# Altium schematic sheet AM_PM_Indicator.SchDoc
size A3; SheetNumber: 7; SheetTotal: 16
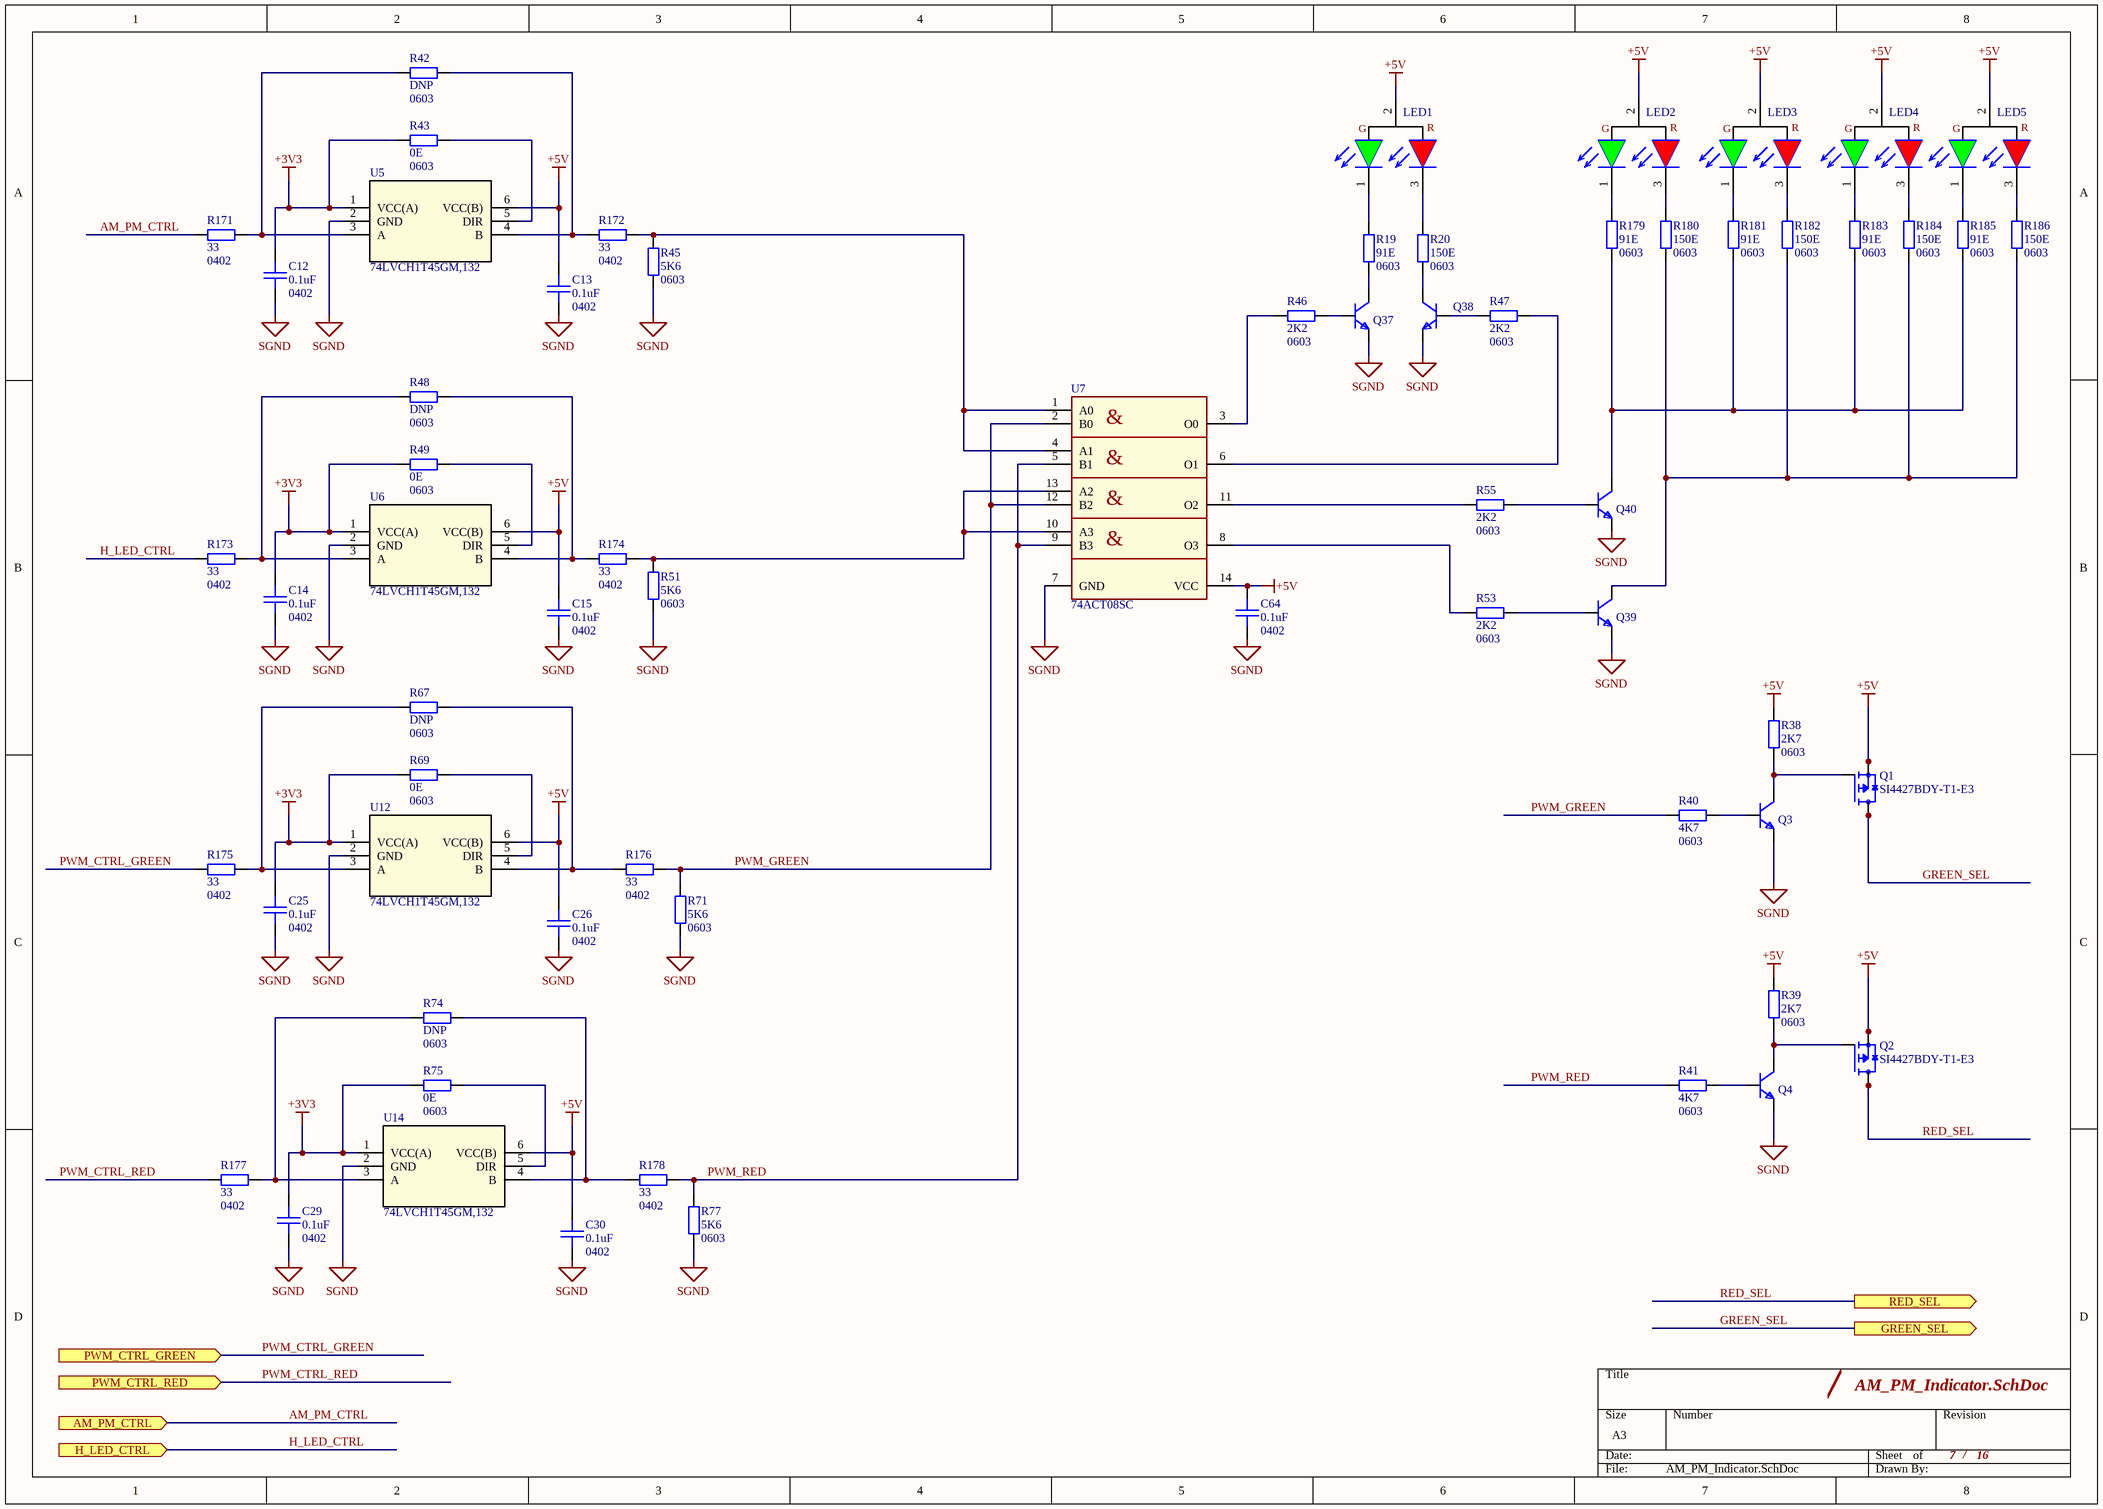
[diagram p0: AM_PM_Indicator.SchDoc]

## Parts
C12  Capacitance: 0.1uF  Package1: 0402  [CAPC100x50x50L25]  (hidden comment: 04023C104KAT2A)
C13  Capacitance: 0.1uF  Package1: 0402  [CAPC100x50x50L25]  (hidden comment: 04023C104KAT2A)
C14  Capacitance: 0.1uF  Package1: 0402  [CAPC100x50x50L25]  (hidden comment: 04023C104KAT2A)
C15  Capacitance: 0.1uF  Package1: 0402  [CAPC100x50x50L25]  (hidden comment: 04023C104KAT2A)
C25  Capacitance: 0.1uF  Package1: 0402  [CAPC100x50x50L25]  (hidden comment: 04023C104KAT2A)
C26  Capacitance: 0.1uF  Package1: 0402  [CAPC100x50x50L25]  (hidden comment: 04023C104KAT2A)
C29  Capacitance: 0.1uF  Package1: 0402  [CAPC100x50x50L25]  (hidden comment: 04023C104KAT2A)
C30  Capacitance: 0.1uF  Package1: 0402  [CAPC100x50x50L25]  (hidden comment: 04023C104KAT2A)
C64  Capacitance: 0.1uF  Package1: 0402  [CAPC100x50x50L25]  (hidden comment: 04023C104KAT2A)
LED1  484759  [LED_3mm_bicolor]  (value not drawn)
LED2  484759  [LED_3mm_bicolor]  (value not drawn)
LED3  484759  [LED_3mm_bicolor]  (value not drawn)
LED4  484759  [LED_3mm_bicolor]  (value not drawn)
LED5  484759  [LED_3mm_bicolor]  (value not drawn)
Q1  SI4427BDY-T1-E3  [SOIC8_127P600X175-8N]
Q2  SI4427BDY-T1-E3  [SOIC8_127P600X175-8N]
Q3  MMBT3904-TP  [SOT-23_MCC]  (value not drawn)
Q4  MMBT3904-TP  [SOT-23_MCC]  (value not drawn)
Q37  MMBT3904-TP  [SOT-23_MCC]  (value not drawn)
Q38  MMBT3904-TP  [SOT-23_MCC]  (value not drawn)
Q39  MMBT3904-TP  [SOT-23_MCC]  (value not drawn)
Q40  MMBT3904-TP  [SOT-23_MCC]  (value not drawn)
R19  Resistance: 91E  Size2: 0603  [RESC160X80X55L30]  (hidden comment: RC0603JR-0791RL)
R20  Resistance: 150E  Size2: 0603  [RESC160X80X55L30]  (hidden comment: RC0603JR-07150RL)
R38  Resistance: 2K7  Size2: 0603  [RESC160X80X55L30]  (hidden comment: RC0603FR-072K7L)
R39  Resistance: 2K7  Size2: 0603  [RESC160X80X55L30]  (hidden comment: RC0603FR-072K7L)
R40  Resistance: 4K7  Size2: 0603  [RESC160X80X55L30]  (hidden comment: RC0603FR-074K7L)
R41  Resistance: 4K7  Size2: 0603  [RESC160X80X55L30]  (hidden comment: RC0603FR-074K7L)
R42  Size2: 0603  [RESC160X80X55L30]  (hidden comment: DNP)
R43  Resistance: 0E  Size2: 0603  [RESC160X80X55L30]  (hidden comment: RC0603JR-070RL)
R45  Resistance: 5K6  Size2: 0603  [RESC160X80X55L30]  (hidden comment: CRCW06035K60JNEA)
R46  Resistance: 2K2  Size2: 0603  [RESC160X80X55L30]  (hidden comment: RC0603FR-072K2L)
R47  Resistance: 2K2  Size2: 0603  [RESC160X80X55L30]  (hidden comment: RC0603FR-072K2L)
R48  Size2: 0603  [RESC160X80X55L30]  (hidden comment: DNP)
R49  Resistance: 0E  Size2: 0603  [RESC160X80X55L30]  (hidden comment: RC0603JR-070RL)
R51  Resistance: 5K6  Size2: 0603  [RESC160X80X55L30]  (hidden comment: CRCW06035K60JNEA)
R53  Resistance: 2K2  Size2: 0603  [RESC160X80X55L30]  (hidden comment: RC0603FR-072K2L)
R55  Resistance: 2K2  Size2: 0603  [RESC160X80X55L30]  (hidden comment: RC0603FR-072K2L)
R67  Resistance: DNP  Size2: 0603  [RESC160X80X55L30]  (hidden comment: RC0603JR-070RL)
R69  Resistance: 0E  Size2: 0603  [RESC160X80X55L30]  (hidden comment: RC0603JR-070RL)
R71  Resistance: 5K6  Size2: 0603  [RESC160X80X55L30]  (hidden comment: CRCW06035K60JNEA)
R74  Size2: 0603  [RESC160X80X55L30]  (hidden comment: DNP)
R75  Resistance: 0E  Size2: 0603  [RESC160X80X55L30]  (hidden comment: RC0603JR-070RL)
R77  Resistance: 5K6  Size2: 0603  [RESC160X80X55L30]  (hidden comment: CRCW06035K60JNEA)
R171  Resistance: 33  Package2: 0402  [RESC100X50X40L25]  (hidden comment: RC0402FR-0733RL)
R172  Resistance: 33  Package2: 0402  [RESC100X50X40L25]  (hidden comment: RC0402FR-0733RL)
R173  Resistance: 33  Package2: 0402  [RESC100X50X40L25]  (hidden comment: RC0402FR-0733RL)
R174  Resistance: 33  Package2: 0402  [RESC100X50X40L25]  (hidden comment: RC0402FR-0733RL)
R175  Resistance: 33  Package2: 0402  [RESC100X50X40L25]  (hidden comment: RC0402FR-0733RL)
R176  Resistance: 33  Package2: 0402  [RESC100X50X40L25]  (hidden comment: RC0402FR-0733RL)
R177  Resistance: 33  Package2: 0402  [RESC100X50X40L25]  (hidden comment: RC0402FR-0733RL)
R178  Resistance: 33  Package2: 0402  [RESC100X50X40L25]  (hidden comment: RC0402FR-0733RL)
R179  Resistance: 91E  Size2: 0603  [RESC160X80X55L30]  (hidden comment: RC0603JR-0791RL)
R180  Resistance: 150E  Size2: 0603  [RESC160X80X55L30]  (hidden comment: RC0603JR-07150RL)
R181  Resistance: 91E  Size2: 0603  [RESC160X80X55L30]  (hidden comment: RC0603JR-0791RL)
R182  Resistance: 150E  Size2: 0603  [RESC160X80X55L30]  (hidden comment: RC0603JR-07150RL)
R183  Resistance: 91E  Size2: 0603  [RESC160X80X55L30]  (hidden comment: RC0603JR-0791RL)
R184  Resistance: 150E  Size2: 0603  [RESC160X80X55L30]  (hidden comment: RC0603JR-07150RL)
R185  Resistance: 91E  Size2: 0603  [RESC160X80X55L30]  (hidden comment: RC0603JR-0791RL)
R186  Resistance: 150E  Size2: 0603  [RESC160X80X55L30]  (hidden comment: RC0603JR-07150RL)
U5  74LVCH1T45GM,132  [74LVCH1T45_XSON6_NEX]
U6  74LVCH1T45GM,132  [74LVCH1T45_XSON6_NEX]
U7  74ACT08SC  [SOIC14P127_865X600X175L83X41]
U12  74LVCH1T45GM,132  [74LVCH1T45_XSON6_NEX]
U14  74LVCH1T45GM,132  [74LVCH1T45_XSON6_NEX]

## Ports
AM_PM_CTRL (in), GREEN_SEL (out), H_LED_CTRL (in), PWM_CTRL_GREEN (in), PWM_CTRL_RED (in), RED_SEL (out)

## Nets
+3V3: C12.2 C14.2 C25.2 C29.2 R43.2 R49.2 R69.2 R75.2 U5.1(VCC(A)) U6.1(VCC(A)) U12.1(VCC(A)) U14.1(VCC(A))
+5V: C13.2 C15.2 C26.2 C30.2 C64.2 LED1.2(A) LED2.2(A) LED3.2(A) LED4.2(A) LED5.2(A) Q1.1(S) Q1.2(S) Q1.3(S) Q2.1(S) Q2.2(S) Q2.3(S) R38.2 R39.2 U5.6(VCC(B)) U6.6(VCC(B)) U7.14(VCC) U12.6(VCC(B)) U14.6(VCC(B))
SGND: C12.1 C13.1 C14.1 C15.1 C25.1 C26.1 C29.1 C30.1 C64.1 Q3.2(E) Q4.2(E) Q37.2(E) Q38.2(E) Q39.2(E) Q40.2(E) R45.1 R51.1 R71.1 R77.1 U5.2(GND) U6.2(GND) U7.7(GND) U12.2(GND) U14.2(GND)
AM_PM_CTRL: R171.2 ; port AM_PM_CTRL
GREEN_SEL: Q1.5(D) Q1.6(D) Q1.7(D) Q1.8(D) ; port GREEN_SEL
H_LED_CTRL: R173.2 ; port H_LED_CTRL
PWM_CTRL_GREEN: R175.2 ; port PWM_CTRL_GREEN
PWM_CTRL_RED: R177.2 ; port PWM_CTRL_RED
PWM_GREEN: R40.2 R71.2 R176.1 U7.2(B0) U7.12(B2)
PWM_RED: R41.2 R77.2 R178.1 U7.5(B1) U7.9(B3)
RED_SEL: Q2.5(D) Q2.6(D) Q2.7(D) Q2.8(D) ; port RED_SEL
NetLED1_1: LED1.1(CG) R19.1
NetLED1_3: LED1.3(CR) R20.1
NetLED2_1: LED2.1(CG) R179.1
NetLED2_3: LED2.3(CR) R180.1
NetLED3_1: LED3.1(CG) R181.1
NetLED3_3: LED3.3(CR) R182.1
NetLED4_1: LED4.1(CG) R183.1
NetLED4_3: LED4.3(CR) R184.1
NetLED5_1: LED5.1(CG) R185.1
NetLED5_3: LED5.3(CR) R186.1
NetQ1_4: Q1.4(G) Q3.3(C) R38.1
NetQ2_4: Q2.4(G) Q4.3(C) R39.1
NetQ3_1: Q3.1(B) R40.1
NetQ4_1: Q4.1(B) R41.1
NetQ37_1: Q37.1(B) R46.2
NetQ37_3: Q37.3(C) R19.2
NetQ38_1: Q38.1(B) R47.1
NetQ38_3: Q38.3(C) R20.2
NetQ39_1: Q39.1(B) R53.2
NetQ39_3: Q39.3(C) R180.2 R182.2 R184.2 R186.2
NetQ40_1: Q40.1(B) R55.2
NetQ40_3: Q40.3(C) R179.2 R181.2 R183.2 R185.2
NetR42_1: R42.1 R172.2 U5.4(B)
NetR42_2: R42.2 R171.1 U5.3(A)
NetR43_1: R43.1 U5.5(DIR)
NetR45_2: R45.2 R172.1 U7.1(A0) U7.4(A1)
NetR46_1: R46.1 U7.3(O0)
NetR47_2: R47.2 U7.6(O1)
NetR48_1: R48.1 R174.2 U6.4(B)
NetR48_2: R48.2 R173.1 U6.3(A)
NetR49_1: R49.1 U6.5(DIR)
NetR51_2: R51.2 R174.1 U7.10(A3) U7.13(A2)
NetR53_1: R53.1 U7.8(O3)
NetR55_1: R55.1 U7.11(O2)
NetR67_1: R67.1 R176.2 U12.4(B)
NetR67_2: R67.2 R175.1 U12.3(A)
NetR69_1: R69.1 U12.5(DIR)
NetR74_1: R74.1 R178.2 U14.4(B)
NetR74_2: R74.2 R177.1 U14.3(A)
NetR75_1: R75.1 U14.5(DIR)

## Notes on the sheet
- /
- (in symbol 74ACT08SC) &
- (in symbol LED_484759_bicolor) G; R

## Library data of the parts
C12-C15 C25 C26 C29 C30 C64 = CMP-001-0374-4: 0402 25V X7R 100 NF 10%; Manufacturer: KYOCERA AVX; Op Temp max: 85°C; Op Temp min: -55°C; ComponentLink3URL: https://www.digikey.com/en/products/detail/yageo/CC0402MRX5R5BB106/5195138; MPN: 04023C104KAT2A; ComponentLink1URL: https://www.yageo.com/upload/media/product/productsearch/datasheet/mlcc/UPY-GPHC_X5R_4V-to-50V_26.pdf; Package: 0402 (1005 Metric); Size: 1.00mm x 0.50mm; Height max: 700µm; Mounting Type: SM; Tolerance: 10%; ComponentLink1Description: Datasheet; ComponentLink3Description: Digikey; Ratings: -; Dielectric: X7R; ComponentLink2Description: Mouser; ComponentLink2URL: https://eu.mouser.com/ProductDetail/YAGEO/CC0402MRX5R5BB106?qs=zEY9bCHj09eCmUJdZuS5Lg%3D%3D; Lead Spacing: 0mm; Component Type: Ceramic Capacitor; Voltage Rating: 25V
LED1-LED5 = LED_484759_bicolor: Parameter 1: https://cdn.shopify.com/s/files/1/0695/1347/8453/files/484759.pdf; ComponentLink1Description: Datasheet; ComponentLink1URL: https://cdn.shopify.com/s/files/1/0695/1347/8453/files/484759.pdf
Q1 Q2 = SI4427BDY-T1-E3: MOSFET P-CH 30V 9.7A 8SO; MF: Vishay Siliconix; Drive Voltage (Max Rds On, Min Rds On): 2.5V, 10V; FET Type: P-Channel; Current - Continuous Drain (Id) @ 25°C: 9.7A (Ta); Vgs(th) (Max) @ Id: 1.4V @ 250µA; Gate Charge (Qg) (Max) @ Vgs: 70 nC @ 4.5 V; DigiKey: https://www.digikey.bg/en/products/detail/vishay-siliconix/SI4427BDY-T1-E3/1656428; MPN: SI4427BDY-T1-E3; Package: SOIC-8 Vishay Siliconix; Drain to Source Voltage (Vdss): 30V; ComponentLink1Description: Datasheet; ComponentLink1URL: https://www.vishay.com/docs/72295/si4427bd.pdf
Q3 Q4 Q37-Q40 = MMBT3904-TP: TRANS NPN 40V 0.2A SOT23; Mfr_Name: MCC; Current - Collector (Ic) (Max): 200 mA; MPN: MMBT3904-TP; Voltage - Collector Emitter Breakdown (Max): 40 V; Transistor Type: NPN
R19 R179 R181 R183 R185 = CMP-001-0628-7: RES 91 OHM 5% 1/10W 0603; Manufacturer: YAGEO; Power: 100mW; Temperature Coefficient: ±100ppm; Tolerance: 1%; Op Temp max: 155°C; Op Temp min: -55°C; PMNT: DNP; Ratings: -; ComponentLink3URL: https://www.digikey.com/en/products/detail/yageo/RC0603FR-0710KL/726880?s=N4IgTCBcDaIEoGEAMA2JBmAYnAtEg7AIxIDSAMiALoC%2BQA; Size: 1.60mm x 0.80mm; ComponentLink1Description: Datasheet; ComponentLink3Description: Digikey; ComponentLink2Description: Mouser; ComponentLink1URL: https://www.yageo.com/upload/media/product/products/datasheet/rchip/PYu-RC_51_RoHS_P_4.pdf; Composition: Thick Film; Package: 0603 (1608 Metric); ComponentLink2URL: https://eu.mouser.com/ProductDetail/YAGEO/RC0603FR-0710KL?qs=grNVn54RoB%252B3GtjbJj3wJQ%3D%3D; Mounting Type: SM; Height max: 550µm; MPN: RC0603JR-0791RL; Component Type: Chip Resistor
R20 R180 R182 R184 R186 = CMP-001-0628-7: RES 150 OHM 5% 1/10W 0603; Manufacturer: YAGEO; Power: 100mW; Temperature Coefficient: ±100ppm; Tolerance: 1%; Op Temp max: 155°C; Op Temp min: -55°C; Ratings: -; ComponentLink3URL: https://www.digikey.com/en/products/detail/yageo/RC0603FR-0710KL/726880?s=N4IgTCBcDaIEoGEAMA2JBmAYnAtEg7AIxIDSAMiALoC%2BQA; Size: 1.60mm x 0.80mm; ComponentLink1Description: Datasheet; ComponentLink3Description: Digikey; ComponentLink2Description: Mouser; ComponentLink1URL: https://www.yageo.com/upload/media/product/products/datasheet/rchip/PYu-RC_51_RoHS_P_4.pdf; Composition: Thick Film; Package: 0603 (1608 Metric); ComponentLink2URL: https://eu.mouser.com/ProductDetail/YAGEO/RC0603FR-0710KL?qs=grNVn54RoB%252B3GtjbJj3wJQ%3D%3D; Mounting Type: SM; Height max: 550µm; MPN: RC0603JR-07150RL; Component Type: Chip Resistor
R38 R39 = CMP-001-0628-7: RES 2.7K OHM 1% 1/10W 0603; Manufacturer: YAGEO; Power: 100mW; Temperature Coefficient: ±100ppm; Op Temp max: 155°C; Op Temp min: -55°C; Ratings: -; ComponentLink3URL: https://www.digikey.com/en/products/detail/yageo/RC0603FR-0710KL/726880?s=N4IgTCBcDaIEoGEAMA2JBmAYnAtEg7AIxIDSAMiALoC%2BQA; Size: 1.60mm x 0.80mm; ComponentLink1Description: Datasheet; ComponentLink3Description: Digikey; ComponentLink2Description: Mouser; ComponentLink1URL: https://www.yageo.com/upload/media/product/products/datasheet/rchip/PYu-RC_51_RoHS_P_4.pdf; Composition: Thick Film; Package: 0603 (1608 Metric); ComponentLink2URL: https://eu.mouser.com/ProductDetail/YAGEO/RC0603FR-0710KL?qs=grNVn54RoB%252B3GtjbJj3wJQ%3D%3D; Mounting Type: SM; Tolerance: 1%; Height max: 550µm; MPN: RC0603FR-072K7L; Component Type: Chip Resistor
R40 R41 = CMP-001-0628-7: RES 4.7K OHM 1% 1/10W 0603; Manufacturer: YAGEO; Power: 100mW; Temperature Coefficient: ±100ppm; Op Temp max: 155°C; Op Temp min: -55°C; PMNT: DNP; Ratings: -; Size: 1.60mm x 0.80mm; ComponentLink1Description: Datasheet; ComponentLink3Description: Digikey; ComponentLink2Description: Mouser; ComponentLink1URL: https://www.yageo.com/upload/media/product/products/datasheet/rchip/PYu-RC_51_RoHS_P_4.pdf; Composition: Thick Film; Package: 0603 (1608 Metric); ComponentLink2URL: https://eu.mouser.com/ProductDetail/YAGEO/RC0603FR-0710KL?qs=grNVn54RoB%252B3GtjbJj3wJQ%3D%3D; Mounting Type: SM; Tolerance: 1%; Height max: 550µm; MPN: RC0603FR-074K7L; Component Type: Chip Resistor
  R40: ComponentLink3URL: https://www.digikey.pl/en/products/detail/yageo/rc0603fr-074k7l/727212
  R41: ComponentLink3URL: https://www.digikey.com/en/products/detail/yageo/RC0603FR-0710KL/726880?s=N4IgTCBcDaIEoGEAMA2JBmAYnAtEg7AIxIDSAMiALoC%2BQA
R42 R48 R67 R74 = CMP-001-0628-7: RES 0 OHM JUMPER 1/10W 0603; Manufacturer: YAGEO; MPN: RC0603FR-0710KL; Power: 100mW; Temperature Coefficient: ±100ppm; Tolerance: 1%; Op Temp max: 155°C; Op Temp min: -55°C; Ratings: -; ComponentLink3URL: https://www.digikey.com/en/products/detail/yageo/RC0603FR-0710KL/726880?s=N4IgTCBcDaIEoGEAMA2JBmAYnAtEg7AIxIDSAMiALoC%2BQA; Size: 1.60mm x 0.80mm; ComponentLink1Description: Datasheet; ComponentLink3Description: Digikey; ComponentLink2Description: Mouser; ComponentLink1URL: https://www.yageo.com/upload/media/product/products/datasheet/rchip/PYu-RC_51_RoHS_P_4.pdf; Composition: Thick Film; Package: 0603 (1608 Metric); ComponentLink2URL: https://eu.mouser.com/ProductDetail/YAGEO/RC0603FR-0710KL?qs=grNVn54RoB%252B3GtjbJj3wJQ%3D%3D; Mounting Type: SM; Height max: 550µm; Component Type: Chip Resistor; PMNT: DNP; DNP: DNP
  R42 R48 R74: Resistance: DNP
R43 R49 R69 R75 = CMP-001-0628-7: RES 0 OHM JUMPER 1/10W 0603; Manufacturer: YAGEO; MPN: RC0603FR-0710KL; Power: 100mW; Temperature Coefficient: ±100ppm; Tolerance: 1%; Op Temp max: 155°C; Op Temp min: -55°C; PMNT: DNP; Ratings: -; ComponentLink3URL: https://www.digikey.com/en/products/detail/yageo/RC0603FR-0710KL/726880?s=N4IgTCBcDaIEoGEAMA2JBmAYnAtEg7AIxIDSAMiALoC%2BQA; Size: 1.60mm x 0.80mm; ComponentLink1Description: Datasheet; ComponentLink3Description: Digikey; ComponentLink2Description: Mouser; ComponentLink1URL: https://www.yageo.com/upload/media/product/products/datasheet/rchip/PYu-RC_51_RoHS_P_4.pdf; Composition: Thick Film; Package: 0603 (1608 Metric); ComponentLink2URL: https://eu.mouser.com/ProductDetail/YAGEO/RC0603FR-0710KL?qs=grNVn54RoB%252B3GtjbJj3wJQ%3D%3D; Mounting Type: SM; Height max: 550µm; Component Type: Chip Resistor
R45 R51 R71 R77 = CMP-001-0628-7: RES SMD 5.6K OHM 5% 1/10W 0603; Manufacturer: YAGEO; MPN: DNP; Power: 100mW; Temperature Coefficient: ±100ppm; Tolerance: 1%; Op Temp max: 155°C; Op Temp min: -55°C; Ratings: -; ComponentLink3URL: https://www.digikey.com/en/products/detail/yageo/RC0603FR-0710KL/726880?s=N4IgTCBcDaIEoGEAMA2JBmAYnAtEg7AIxIDSAMiALoC%2BQA; Size: 1.60mm x 0.80mm; ComponentLink1Description: Datasheet; ComponentLink3Description: Digikey; ComponentLink2Description: Mouser; ComponentLink1URL: https://www.yageo.com/upload/media/product/products/datasheet/rchip/PYu-RC_51_RoHS_P_4.pdf; Composition: Thick Film; Package: 0603 (1608 Metric); ComponentLink2URL: https://eu.mouser.com/ProductDetail/YAGEO/RC0603FR-0710KL?qs=grNVn54RoB%252B3GtjbJj3wJQ%3D%3D; Mounting Type: SM; Height max: 550µm; Component Type: Chip Resistor
R46 R47 R53 R55 = CMP-001-0628-7: RES 2.2K OHM 1% 1/10W 0603; Manufacturer: YAGEO; Power: 100mW; Temperature Coefficient: ±100ppm; Op Temp max: 155°C; Op Temp min: -55°C; PMNT: DNP; Ratings: -; Size: 1.60mm x 0.80mm; ComponentLink1Description: Datasheet; ComponentLink3Description: Digikey; ComponentLink2Description: Mouser; ComponentLink1URL: https://www.yageo.com/upload/media/product/products/datasheet/rchip/PYu-RC_51_RoHS_P_4.pdf; Composition: Thick Film; Package: 0603 (1608 Metric); ComponentLink2URL: https://eu.mouser.com/ProductDetail/YAGEO/RC0603FR-0710KL?qs=grNVn54RoB%252B3GtjbJj3wJQ%3D%3D; Mounting Type: SM; Tolerance: 1%; Height max: 550µm; MPN: RC0603FR-072K2L; Component Type: Chip Resistor
  R46 R47: ComponentLink3URL: https://www.digikey.com/en/products/detail/yageo/RC0603FR-0710KL/726880?s=N4IgTCBcDaIEoGEAMA2JBmAYnAtEg7AIxIDSAMiALoC%2BQA
  R53 R55: ComponentLink3URL: https://www.digikey.pl/en/products/detail/yageo/rc0603fr-072k2l/727016
R171-R178 = CMP-001-0484-6: RES 33 OHM 1% 1/16W 0402; Manufacturer: YAGEO; Power: 63mW; Op Temp min: -55°C; Temperature Coefficient: ±100ppm; Op Temp max: 155°C; ComponentLink3URL: https://www.digikey.com/en/products/detail/yageo/RC0402FR-0727RL/5280946; ComponentLink2Description: Mouser; Ratings: -; Tolerance: 1%; Height max: 400µm; MPN: RC0402FR-0733RL; ComponentLink1URL: https://www.yageo.com/upload/media/product/productsearch/datasheet/rchip/PYu-RC_Group_51_RoHS_L_12.pdf; Size: 1.00mm x 0.50mm; Composition: Thick Film; Package: 0402 (1005 Metric); ComponentLink3Description: Digikey; Mounting Type: SM; ComponentLink2URL: https://eu.mouser.com/ProductDetail/YAGEO/RC0402FR-0727RL?qs=UOUeRUa%252B8Wlb37UyFHw9Bw%3D%3D; ComponentLink1Description: Datasheet; Component Type: Chip Resistor
U5 U6 U12 U14 = 74LVCH1T45GM,132: IC TRANSLTR BIDIRECTIONAL 6XSON; Mfr_Name: Nexperia; Voltage min: 1.2 V; Moltage max: 5.5 V; MPN: 74LVCH1T45GM,132
U7 = 74ACT08SC: IC GATE AND 4CH 2-INP 14SOIC; Voltage: 4.5V - 5.5V; MF: onsemi; Value: *; MPN: 74ACT08SC; Package: SOIC-14 ON